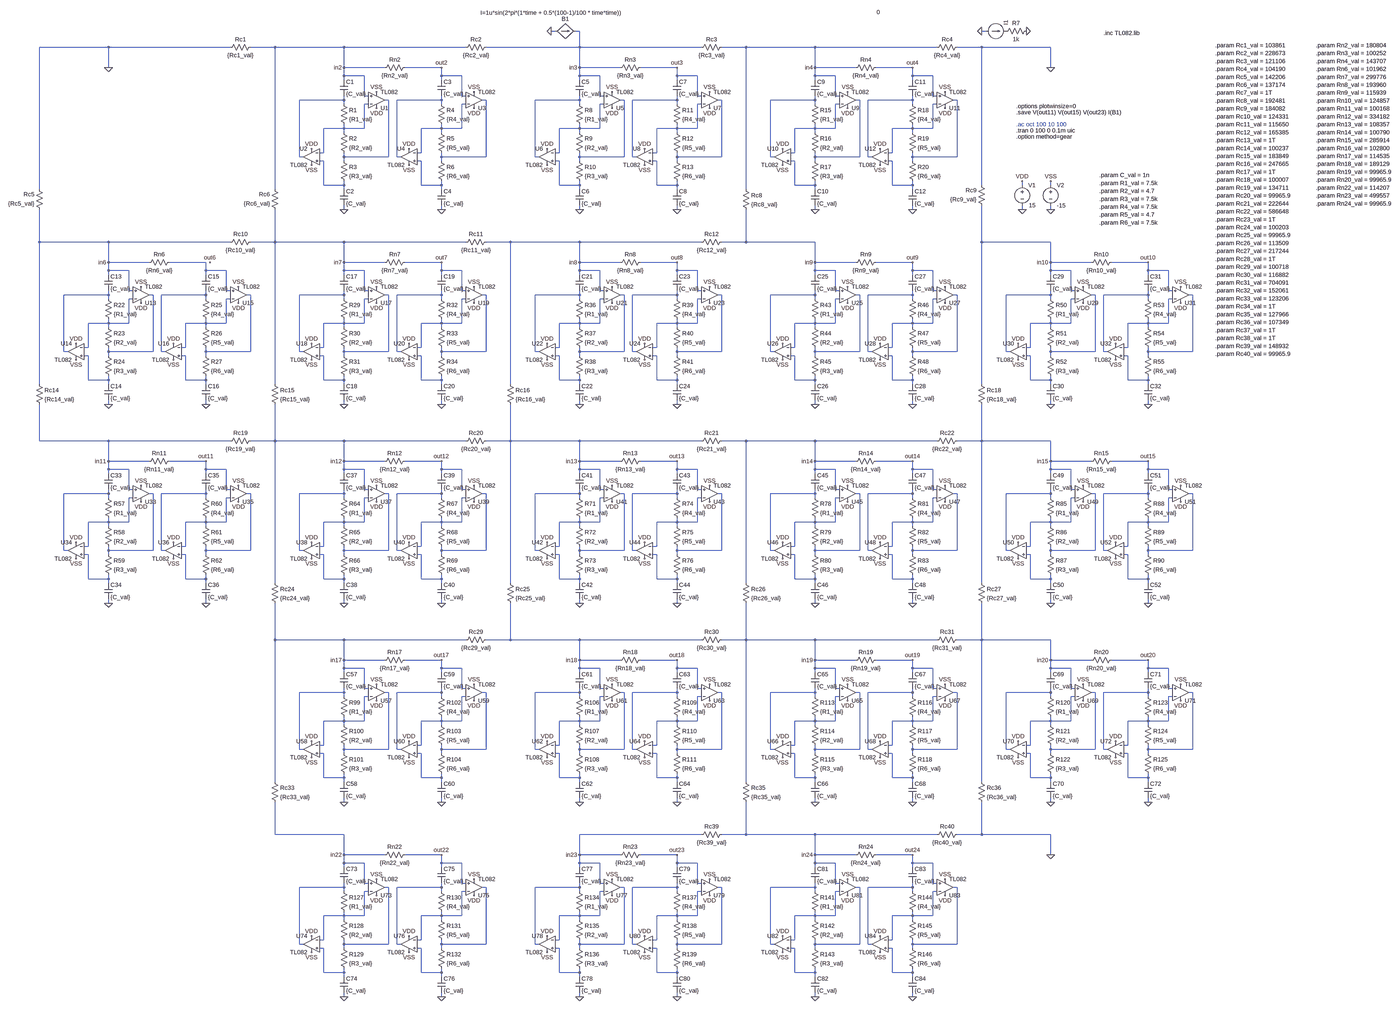
[diagram p0: schematic drone_sweep.asc, whole sheet]
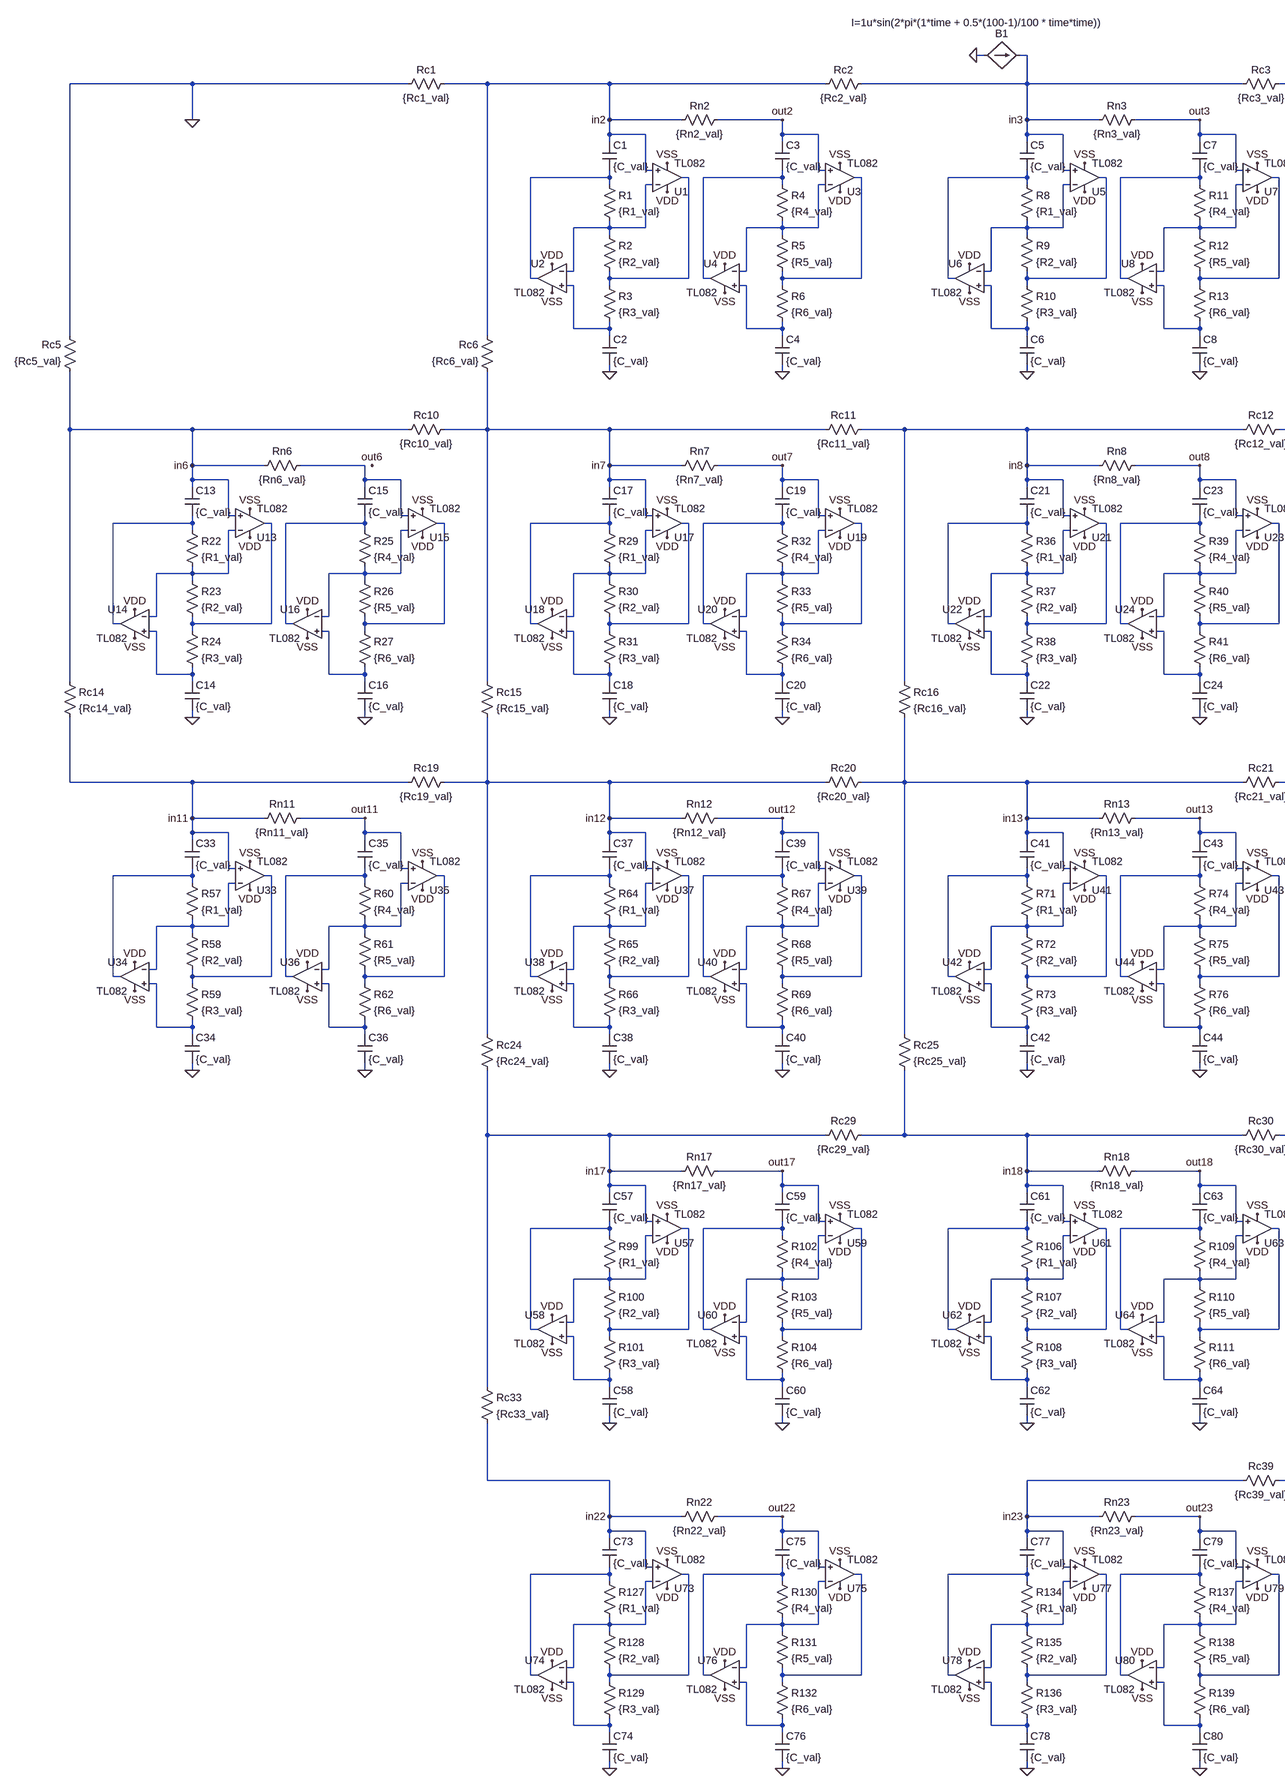
[diagram p1: schematic drone_sweep.asc, part, row 1 of 1, column 1 of 2]
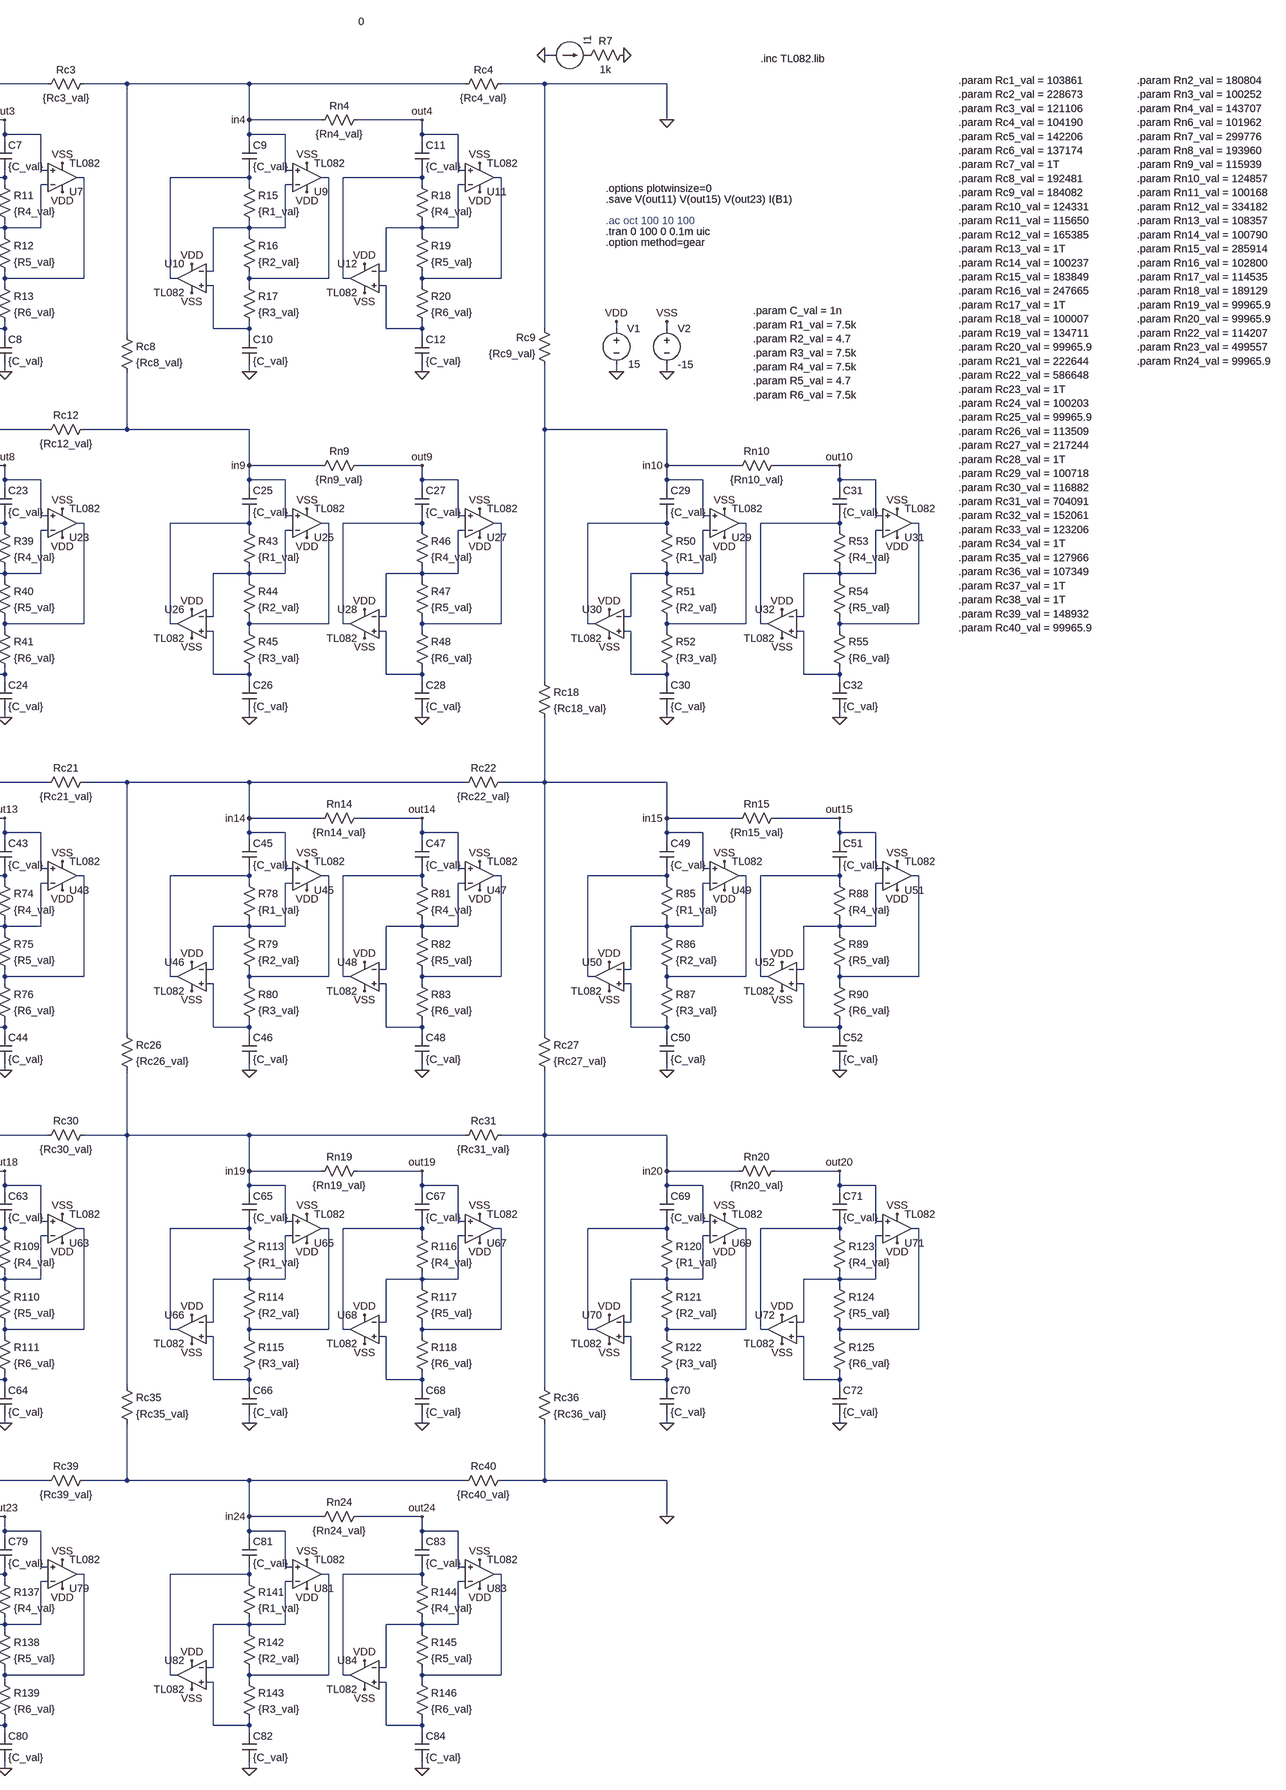
[diagram p2: schematic drone_sweep.asc, part, row 1 of 1, column 2 of 2]
* drone_sweep.asc
V1 VDD 0 15
V2 VSS 0 -15
C1 in2 N001 {C_val}
R1 N001 N013 {R1_val}
R2 N013 N002 {R2_val}
R3 N002 N019 {R3_val}
C2 N019 0 {C_val}
C3 out2 N003 {C_val}
R4 N003 N014 {R4_val}
R5 N014 N004 {R5_val}
R6 N004 N020 {R6_val}
C4 N020 0 {C_val}
Rn2 out2 in2 {Rn2_val}
C5 in3 N005 {C_val}
R8 N005 N015 {R1_val}
R9 N015 N006 {R2_val}
R10 N006 N021 {R3_val}
C6 N021 0 {C_val}
C7 out3 N007 {C_val}
R11 N007 N016 {R4_val}
R12 N016 N008 {R5_val}
R13 N008 N022 {R6_val}
C8 N022 0 {C_val}
Rn3 out3 in3 {Rn3_val}
C9 in4 N009 {C_val}
R15 N009 N017 {R1_val}
R16 N017 N010 {R2_val}
R17 N010 N023 {R3_val}
C10 N023 0 {C_val}
C11 out4 N011 {C_val}
R18 N011 N018 {R4_val}
R19 N018 N012 {R5_val}
R20 N012 N024 {R6_val}
C12 N024 0 {C_val}
Rn4 out4 in4 {Rn4_val}
C13 in6 N026 {C_val}
R22 N026 N046 {R1_val}
R23 N046 N027 {R2_val}
R24 N027 N056 {R3_val}
C14 N056 0 {C_val}
C15 N025 N028 {C_val}
R25 N028 N047 {R4_val}
R26 N047 N029 {R5_val}
R27 N029 N057 {R6_val}
C16 N057 0 {C_val}
Rn6 N025 in6 {Rn6_val}
C17 in7 N030 {C_val}
R29 N030 N048 {R1_val}
R30 N048 N031 {R2_val}
R31 N031 N058 {R3_val}
C18 N058 0 {C_val}
C19 out7 N032 {C_val}
R32 N032 N049 {R4_val}
R33 N049 N033 {R5_val}
R34 N033 N059 {R6_val}
C20 N059 0 {C_val}
Rn7 out7 in7 {Rn7_val}
C21 in8 N034 {C_val}
R36 N034 N050 {R1_val}
R37 N050 N035 {R2_val}
R38 N035 N060 {R3_val}
C22 N060 0 {C_val}
C23 out8 N036 {C_val}
R39 N036 N051 {R4_val}
R40 N051 N037 {R5_val}
R41 N037 N061 {R6_val}
C24 N061 0 {C_val}
Rn8 out8 in8 {Rn8_val}
C25 in9 N038 {C_val}
R43 N038 N052 {R1_val}
R44 N052 N039 {R2_val}
R45 N039 N062 {R3_val}
C26 N062 0 {C_val}
C27 out9 N040 {C_val}
R46 N040 N053 {R4_val}
R47 N053 N041 {R5_val}
R48 N041 N063 {R6_val}
C28 N063 0 {C_val}
Rn9 out9 in9 {Rn9_val}
C29 in10 N042 {C_val}
R50 N042 N054 {R1_val}
R51 N054 N043 {R2_val}
R52 N043 N064 {R3_val}
C30 N064 0 {C_val}
C31 out10 N044 {C_val}
R53 N044 N055 {R4_val}
R54 N055 N045 {R5_val}
R55 N045 N065 {R6_val}
C32 N065 0 {C_val}
Rn10 out10 in10 {Rn10_val}
C33 in11 N066 {C_val}
R57 N066 N086 {R1_val}
R58 N086 N067 {R2_val}
R59 N067 N096 {R3_val}
C34 N096 0 {C_val}
C35 out11 N068 {C_val}
R60 N068 N087 {R4_val}
R61 N087 N069 {R5_val}
R62 N069 N097 {R6_val}
C36 N097 0 {C_val}
Rn11 out11 in11 {Rn11_val}
C37 in12 N070 {C_val}
R64 N070 N088 {R1_val}
R65 N088 N071 {R2_val}
R66 N071 N098 {R3_val}
C38 N098 0 {C_val}
C39 out12 N072 {C_val}
R67 N072 N089 {R4_val}
R68 N089 N073 {R5_val}
R69 N073 N099 {R6_val}
C40 N099 0 {C_val}
Rn12 out12 in12 {Rn12_val}
C41 in13 N074 {C_val}
R71 N074 N090 {R1_val}
R72 N090 N075 {R2_val}
R73 N075 N100 {R3_val}
C42 N100 0 {C_val}
C43 out13 N076 {C_val}
R74 N076 N091 {R4_val}
R75 N091 N077 {R5_val}
R76 N077 N101 {R6_val}
C44 N101 0 {C_val}
Rn13 out13 in13 {Rn13_val}
C45 in14 N078 {C_val}
R78 N078 N092 {R1_val}
R79 N092 N079 {R2_val}
R80 N079 N102 {R3_val}
C46 N102 0 {C_val}
C47 out14 N080 {C_val}
R81 N080 N093 {R4_val}
R82 N093 N081 {R5_val}
R83 N081 N103 {R6_val}
C48 N103 0 {C_val}
Rn14 out14 in14 {Rn14_val}
C49 in15 N082 {C_val}
R85 N082 N094 {R1_val}
R86 N094 N083 {R2_val}
R87 N083 N104 {R3_val}
C50 N104 0 {C_val}
C51 out15 N084 {C_val}
R88 N084 N095 {R4_val}
R89 N095 N085 {R5_val}
R90 N085 N105 {R6_val}
C52 N105 0 {C_val}
Rn15 out15 in15 {Rn15_val}
C57 in17 N106 {C_val}
R99 N106 N122 {R1_val}
R100 N122 N107 {R2_val}
R101 N107 N130 {R3_val}
C58 N130 0 {C_val}
C59 out17 N108 {C_val}
R102 N108 N123 {R4_val}
R103 N123 N109 {R5_val}
R104 N109 N131 {R6_val}
C60 N131 0 {C_val}
Rn17 out17 in17 {Rn17_val}
C61 in18 N110 {C_val}
R106 N110 N124 {R1_val}
R107 N124 N111 {R2_val}
R108 N111 N132 {R3_val}
C62 N132 0 {C_val}
C63 out18 N112 {C_val}
R109 N112 N125 {R4_val}
R110 N125 N113 {R5_val}
R111 N113 N133 {R6_val}
C64 N133 0 {C_val}
Rn18 out18 in18 {Rn18_val}
C65 in19 N114 {C_val}
R113 N114 N126 {R1_val}
R114 N126 N115 {R2_val}
R115 N115 N134 {R3_val}
C66 N134 0 {C_val}
C67 out19 N116 {C_val}
R116 N116 N127 {R4_val}
R117 N127 N117 {R5_val}
R118 N117 N135 {R6_val}
C68 N135 0 {C_val}
Rn19 out19 in19 {Rn19_val}
C69 in20 N118 {C_val}
R120 N118 N128 {R1_val}
R121 N128 N119 {R2_val}
R122 N119 N136 {R3_val}
C70 N136 0 {C_val}
C71 out20 N120 {C_val}
R123 N120 N129 {R4_val}
R124 N129 N121 {R5_val}
R125 N121 N137 {R6_val}
C72 N137 0 {C_val}
Rn20 out20 in20 {Rn20_val}
C73 in22 N138 {C_val}
R127 N138 N150 {R1_val}
R128 N150 N139 {R2_val}
R129 N139 N156 {R3_val}
C74 N156 0 {C_val}
C75 out22 N140 {C_val}
R130 N140 N151 {R4_val}
R131 N151 N141 {R5_val}
R132 N141 N157 {R6_val}
C76 N157 0 {C_val}
Rn22 out22 in22 {Rn22_val}
C77 in23 N142 {C_val}
R134 N142 N152 {R1_val}
R135 N152 N143 {R2_val}
R136 N143 N158 {R3_val}
C78 N158 0 {C_val}
C79 out23 N144 {C_val}
R137 N144 N153 {R4_val}
R138 N153 N145 {R5_val}
R139 N145 N159 {R6_val}
C80 N159 0 {C_val}
Rn23 out23 in23 {Rn23_val}
C81 in24 N146 {C_val}
R141 N146 N154 {R1_val}
R142 N154 N147 {R2_val}
R143 N147 N160 {R3_val}
C82 N160 0 {C_val}
C83 out24 N148 {C_val}
R144 N148 N155 {R4_val}
R145 N155 N149 {R5_val}
R146 N149 N161 {R6_val}
C84 N161 0 {C_val}
Rn24 out24 in24 {Rn24_val}
Rc2 in3 in2 {Rc2_val}
Rc3 in4 in3 {Rc3_val}
Rc6 in7 in2 {Rc6_val}
Rc11 in7 in8 {Rc11_val}
Rc12 in8 in9 {Rc12_val}
Rc14 in6 in11 {Rc14_val}
Rc15 in7 in12 {Rc15_val}
Rc16 in8 in13 {Rc16_val}
Rc18 in10 in15 {Rc18_val}
Rc21 in14 in13 {Rc21_val}
Rc22 in15 in14 {Rc22_val}
Rc24 in12 in17 {Rc24_val}
Rc25 in13 in18 {Rc25_val}
Rc26 in14 in19 {Rc26_val}
Rc27 in15 in20 {Rc27_val}
Rc30 in19 in18 {Rc30_val}
Rc33 in17 in22 {Rc33_val}
Rc35 in19 in24 {Rc35_val}
Rc36 in20 0 {Rc36_val}
Rc1 in2 0 {Rc1_val}
Rc5 in6 0 {Rc5_val}
Rc9 in10 0 {Rc9_val}
Rc4 in4 0 {Rc4_val}
Rc39 in24 in23 {Rc39_val}
Rc40 0 in24 {Rc40_val}
R7 0 P001 1k
B1 0 in3 I=1u*sin(2*pi*(1*time + 0.5*(100-1)/100 * time*time))
I1 0 P001 0
X§U1 in2 N013 VDD VSS N002 TL082  ; pins In+ In- V+ V- OUT
X§U2 N019 N013 VDD VSS N001 TL082  ; pins In+ In- V+ V- OUT
X§U3 out2 N014 VDD VSS N004 TL082  ; pins In+ In- V+ V- OUT
X§U4 N020 N014 VDD VSS N003 TL082  ; pins In+ In- V+ V- OUT
X§U5 in3 N015 VDD VSS N006 TL082  ; pins In+ In- V+ V- OUT
X§U6 N021 N015 VDD VSS N005 TL082  ; pins In+ In- V+ V- OUT
X§U7 out3 N016 VDD VSS N008 TL082  ; pins In+ In- V+ V- OUT
X§U8 N022 N016 VDD VSS N007 TL082  ; pins In+ In- V+ V- OUT
X§U9 in4 N017 VDD VSS N010 TL082  ; pins In+ In- V+ V- OUT
X§U10 N023 N017 VDD VSS N009 TL082  ; pins In+ In- V+ V- OUT
X§U11 out4 N018 VDD VSS N012 TL082  ; pins In+ In- V+ V- OUT
X§U12 N024 N018 VDD VSS N011 TL082  ; pins In+ In- V+ V- OUT
X§U13 in6 N046 VDD VSS N027 TL082  ; pins In+ In- V+ V- OUT
X§U14 N056 N046 VDD VSS N026 TL082  ; pins In+ In- V+ V- OUT
X§U15 N025 N047 VDD VSS N029 TL082  ; pins In+ In- V+ V- OUT
X§U16 N057 N047 VDD VSS N028 TL082  ; pins In+ In- V+ V- OUT
X§U17 in7 N048 VDD VSS N031 TL082  ; pins In+ In- V+ V- OUT
X§U18 N058 N048 VDD VSS N030 TL082  ; pins In+ In- V+ V- OUT
X§U19 out7 N049 VDD VSS N033 TL082  ; pins In+ In- V+ V- OUT
X§U20 N059 N049 VDD VSS N032 TL082  ; pins In+ In- V+ V- OUT
X§U21 in8 N050 VDD VSS N035 TL082  ; pins In+ In- V+ V- OUT
X§U22 N060 N050 VDD VSS N034 TL082  ; pins In+ In- V+ V- OUT
X§U23 out8 N051 VDD VSS N037 TL082  ; pins In+ In- V+ V- OUT
X§U24 N061 N051 VDD VSS N036 TL082  ; pins In+ In- V+ V- OUT
X§U25 in9 N052 VDD VSS N039 TL082  ; pins In+ In- V+ V- OUT
X§U26 N062 N052 VDD VSS N038 TL082  ; pins In+ In- V+ V- OUT
X§U27 out9 N053 VDD VSS N041 TL082  ; pins In+ In- V+ V- OUT
X§U28 N063 N053 VDD VSS N040 TL082  ; pins In+ In- V+ V- OUT
X§U29 in10 N054 VDD VSS N043 TL082  ; pins In+ In- V+ V- OUT
X§U30 N064 N054 VDD VSS N042 TL082  ; pins In+ In- V+ V- OUT
X§U31 out10 N055 VDD VSS N045 TL082  ; pins In+ In- V+ V- OUT
X§U32 N065 N055 VDD VSS N044 TL082  ; pins In+ In- V+ V- OUT
X§U33 in11 N086 VDD VSS N067 TL082  ; pins In+ In- V+ V- OUT
X§U34 N096 N086 VDD VSS N066 TL082  ; pins In+ In- V+ V- OUT
X§U35 out11 N087 VDD VSS N069 TL082  ; pins In+ In- V+ V- OUT
X§U36 N097 N087 VDD VSS N068 TL082  ; pins In+ In- V+ V- OUT
X§U37 in12 N088 VDD VSS N071 TL082  ; pins In+ In- V+ V- OUT
X§U38 N098 N088 VDD VSS N070 TL082  ; pins In+ In- V+ V- OUT
X§U39 out12 N089 VDD VSS N073 TL082  ; pins In+ In- V+ V- OUT
X§U40 N099 N089 VDD VSS N072 TL082  ; pins In+ In- V+ V- OUT
X§U41 in13 N090 VDD VSS N075 TL082  ; pins In+ In- V+ V- OUT
X§U42 N100 N090 VDD VSS N074 TL082  ; pins In+ In- V+ V- OUT
X§U43 out13 N091 VDD VSS N077 TL082  ; pins In+ In- V+ V- OUT
X§U44 N101 N091 VDD VSS N076 TL082  ; pins In+ In- V+ V- OUT
X§U45 in14 N092 VDD VSS N079 TL082  ; pins In+ In- V+ V- OUT
X§U46 N102 N092 VDD VSS N078 TL082  ; pins In+ In- V+ V- OUT
X§U47 out14 N093 VDD VSS N081 TL082  ; pins In+ In- V+ V- OUT
X§U48 N103 N093 VDD VSS N080 TL082  ; pins In+ In- V+ V- OUT
X§U49 in15 N094 VDD VSS N083 TL082  ; pins In+ In- V+ V- OUT
X§U50 N104 N094 VDD VSS N082 TL082  ; pins In+ In- V+ V- OUT
X§U51 out15 N095 VDD VSS N085 TL082  ; pins In+ In- V+ V- OUT
X§U52 N105 N095 VDD VSS N084 TL082  ; pins In+ In- V+ V- OUT
X§U57 in17 N122 VDD VSS N107 TL082  ; pins In+ In- V+ V- OUT
X§U58 N130 N122 VDD VSS N106 TL082  ; pins In+ In- V+ V- OUT
X§U59 out17 N123 VDD VSS N109 TL082  ; pins In+ In- V+ V- OUT
X§U60 N131 N123 VDD VSS N108 TL082  ; pins In+ In- V+ V- OUT
X§U61 in18 N124 VDD VSS N111 TL082  ; pins In+ In- V+ V- OUT
X§U62 N132 N124 VDD VSS N110 TL082  ; pins In+ In- V+ V- OUT
X§U63 out18 N125 VDD VSS N113 TL082  ; pins In+ In- V+ V- OUT
X§U64 N133 N125 VDD VSS N112 TL082  ; pins In+ In- V+ V- OUT
X§U65 in19 N126 VDD VSS N115 TL082  ; pins In+ In- V+ V- OUT
X§U66 N134 N126 VDD VSS N114 TL082  ; pins In+ In- V+ V- OUT
X§U67 out19 N127 VDD VSS N117 TL082  ; pins In+ In- V+ V- OUT
X§U68 N135 N127 VDD VSS N116 TL082  ; pins In+ In- V+ V- OUT
X§U69 in20 N128 VDD VSS N119 TL082  ; pins In+ In- V+ V- OUT
X§U70 N136 N128 VDD VSS N118 TL082  ; pins In+ In- V+ V- OUT
X§U71 out20 N129 VDD VSS N121 TL082  ; pins In+ In- V+ V- OUT
X§U72 N137 N129 VDD VSS N120 TL082  ; pins In+ In- V+ V- OUT
X§U73 in22 N150 VDD VSS N139 TL082  ; pins In+ In- V+ V- OUT
X§U74 N156 N150 VDD VSS N138 TL082  ; pins In+ In- V+ V- OUT
X§U75 out22 N151 VDD VSS N141 TL082  ; pins In+ In- V+ V- OUT
X§U76 N157 N151 VDD VSS N140 TL082  ; pins In+ In- V+ V- OUT
X§U77 in23 N152 VDD VSS N143 TL082  ; pins In+ In- V+ V- OUT
X§U78 N158 N152 VDD VSS N142 TL082  ; pins In+ In- V+ V- OUT
X§U79 out23 N153 VDD VSS N145 TL082  ; pins In+ In- V+ V- OUT
X§U80 N159 N153 VDD VSS N144 TL082  ; pins In+ In- V+ V- OUT
X§U81 in24 N154 VDD VSS N147 TL082  ; pins In+ In- V+ V- OUT
X§U82 N160 N154 VDD VSS N146 TL082  ; pins In+ In- V+ V- OUT
X§U83 out24 N155 VDD VSS N149 TL082  ; pins In+ In- V+ V- OUT
X§U84 N161 N155 VDD VSS N148 TL082  ; pins In+ In- V+ V- OUT
Rc8 in4 in9 {Rc8_val}
Rc10 in7 in6 {Rc10_val}
Rc19 in12 in11 {Rc19_val}
Rc20 in13 in12 {Rc20_val}
Rc29 in18 in17 {Rc29_val}
Rc31 in20 in19 {Rc31_val}
* .ac oct 100 10 100
.tran 0 100 0 0.1m uic
.option method=gear
.inc TL082.lib
.param C_val = 1n
.param R1_val = 7.5k
.param R2_val = 4.7
.param R3_val = 7.5k
.param R4_val = 7.5k
.param R5_val = 4.7
.param R6_val = 7.5k
.param Rc1_val = 103861
.param Rc2_val = 228673
.param Rc3_val = 121106
.param Rc4_val = 104190
.param Rc5_val = 142206
.param Rc6_val = 137174
.param Rc7_val = 1T
.param Rc8_val = 192481
.param Rc9_val = 184082
.param Rc10_val = 124331
.param Rc11_val = 115650
.param Rc12_val = 165385
.param Rc13_val = 1T
.param Rc14_val = 100237
.param Rc15_val = 183849
.param Rc16_val = 247665
.param Rc17_val = 1T
.param Rc18_val = 100007
.param Rc19_val = 134711
.param Rc20_val = 99965.9
.param Rc21_val = 222644
.param Rc22_val = 586648
.param Rc23_val = 1T
.param Rc24_val = 100203
.param Rc25_val = 99965.9
.param Rc26_val = 113509
.param Rc27_val = 217244
.param Rc28_val = 1T
.param Rc29_val = 100718
.param Rc30_val = 116882
.param Rc31_val = 704091
.param Rc32_val = 152061
.param Rc33_val = 123206
.param Rc34_val = 1T
.param Rc35_val = 127966
.param Rc36_val = 107349
.param Rc37_val = 1T
.param Rc38_val = 1T
.param Rc39_val = 148932
.param Rc40_val = 99965.9
.param Rn2_val = 180804
.param Rn3_val = 100252
.param Rn4_val = 143707
.param Rn6_val = 101962
.param Rn7_val = 299776
.param Rn8_val = 193960
.param Rn9_val = 115939
.param Rn10_val = 124857
.param Rn11_val = 100168
.param Rn12_val = 334182
.param Rn13_val = 108357
.param Rn14_val = 100790
.param Rn15_val = 285914
.param Rn16_val = 102800
.param Rn17_val = 114535
.param Rn18_val = 189129
.param Rn19_val = 99965.9
.param Rn20_val = 99965.9
.param Rn22_val = 114207
.param Rn23_val = 499557
.param Rn24_val = 99965.9
.save V(out11) V(out15) V(out23) I(B1)
.options plotwinsize=0
.backanno
.end